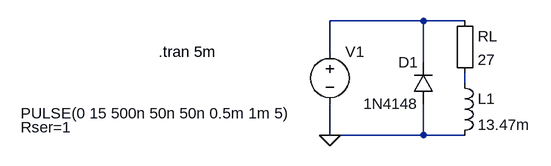
[diagram p0: schematic Alternator_RL.asc]
Alternator_RL.asc, the LTspice schematic file:
Version 4
SHEET 1 880 680
WIRE 96 256 -48 256
WIRE 160 256 96 256
WIRE -48 304 -48 256
WIRE 96 320 96 256
WIRE 160 352 160 336
WIRE -48 432 -48 384
WIRE 96 432 96 384
WIRE 96 432 -48 432
WIRE 160 432 96 432
FLAG -48 432 0
SYMBOL voltage -48 288 R0
WINDOW 3 -476 110 Left 2
WINDOW 39 -476 132 Left 2
SYMATTR InstName V1
SYMATTR Value PULSE(0 15 500n 50n 50n 0.5m 1m 5)
SYMATTR SpiceLine Rser=1
SYMBOL ind 144 336 R0
SYMATTR InstName L1
SYMATTR Value 13.47m
SYMBOL diode 112 384 R180
WINDOW 0 24 64 Left 2
WINDOW 3 24 0 Left 2
SYMATTR InstName D1
SYMATTR Value 1N4148
SYMBOL Misc/EuropeanResistor 144 240 R0
SYMATTR InstName RL
SYMATTR Value 27
TEXT -312 304 Left 2 !.tran 5m

The netlist it stands for:
* Alternator_RL.asc
V1 N001 0 PULSE(0 15 500n 50n 50n 0.5m 1m 5) Rser=1
L1 N002 0 13.47m
D1 0 N001 1N4148
RL N001 N002 27
.model D D
.lib standard.dio
.tran 5m
.backanno
.end